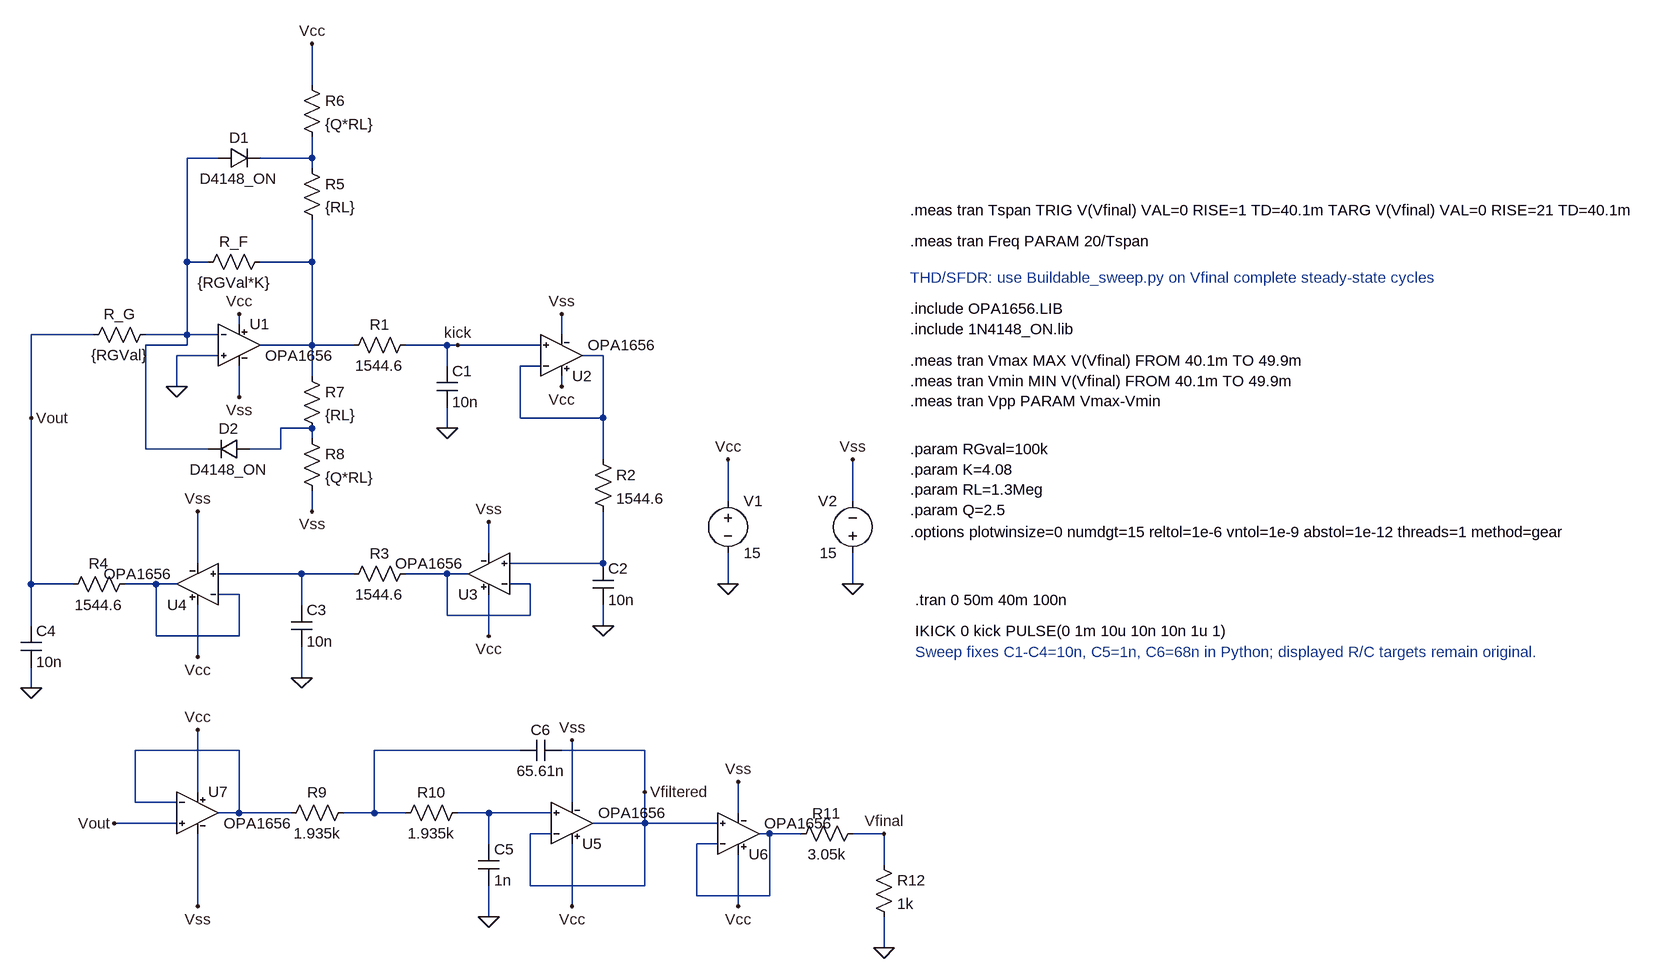
[diagram p0: schematic Oscillator.asc]
Oscillator.asc, the LTspice schematic file:
Version 4.1
SHEET 1 2392 1108
WIRE 272 -240 272 -304
WIRE 128 -128 80 -128
WIRE 272 -128 272 -160
WIRE 272 -128 192 -128
WIRE 272 -112 272 -128
WIRE 80 32 80 -128
WIRE 112 32 80 32
WIRE 272 32 272 -32
WIRE 272 32 192 32
WIRE 160 128 160 112
WIRE -64 144 -160 144
WIRE 80 144 80 32
WIRE 80 144 16 144
WIRE 128 144 80 144
WIRE 656 144 656 112
WIRE 80 160 80 144
WIRE 80 160 16 160
WIRE 272 160 272 32
WIRE 272 160 192 160
WIRE 336 160 272 160
WIRE 480 160 416 160
WIRE 496 160 480 160
WIRE 624 160 496 160
WIRE 128 176 64 176
WIRE 720 176 688 176
WIRE 480 192 480 160
WIRE 624 192 592 192
WIRE 272 208 272 160
WIRE 64 224 64 176
WIRE 656 224 656 208
WIRE 160 240 160 192
WIRE -160 272 -160 144
WIRE 592 272 592 192
WIRE 720 272 720 176
WIRE 720 272 592 272
WIRE 272 288 224 288
WIRE 480 288 480 256
WIRE 272 304 272 288
WIRE 16 320 16 160
WIRE 112 320 16 320
WIRE 224 320 224 288
WIRE 224 320 176 320
WIRE 720 336 720 272
WIRE 912 400 912 336
WIRE 1104 400 1104 336
WIRE 272 416 272 384
WIRE 544 480 544 432
WIRE 96 496 96 416
WIRE 720 496 720 416
WIRE 720 496 576 496
WIRE 256 512 128 512
WIRE 336 512 256 512
WIRE 480 512 416 512
WIRE 512 512 480 512
WIRE -160 528 -160 272
WIRE -96 528 -160 528
WIRE 32 528 -16 528
WIRE 64 528 32 528
WIRE 608 528 576 528
WIRE 912 528 912 480
WIRE 1104 528 1104 480
WIRE 160 544 128 544
WIRE 256 560 256 512
WIRE 480 576 480 512
WIRE 608 576 608 528
WIRE 608 576 480 576
WIRE -160 592 -160 528
WIRE 720 592 720 560
WIRE 32 608 32 528
WIRE 160 608 160 544
WIRE 160 608 32 608
WIRE 544 608 544 544
WIRE 96 640 96 560
WIRE 256 672 256 624
WIRE -160 688 -160 656
WIRE 160 784 0 784
WIRE 592 784 368 784
WIRE 784 784 656 784
WIRE 96 848 96 752
WIRE 784 848 784 784
WIRE 0 864 0 784
WIRE 64 864 0 864
WIRE 672 864 672 768
WIRE 160 880 160 784
WIRE 160 880 128 880
WIRE 240 880 160 880
WIRE 368 880 368 784
WIRE 368 880 320 880
WIRE 416 880 368 880
WIRE 544 880 496 880
WIRE 640 880 544 880
WIRE 928 880 928 832
WIRE 64 896 -32 896
WIRE 784 896 784 848
WIRE 784 896 704 896
WIRE 896 896 784 896
WIRE 640 912 608 912
WIRE 976 912 960 912
WIRE 1024 912 976 912
WIRE 1152 912 1104 912
WIRE 544 928 544 880
WIRE 896 928 864 928
WIRE 1152 960 1152 912
WIRE 608 992 608 912
WIRE 784 992 784 896
WIRE 784 992 608 992
WIRE 864 1008 864 928
WIRE 976 1008 976 912
WIRE 976 1008 864 1008
WIRE 96 1024 96 912
WIRE 672 1024 672 928
WIRE 928 1024 928 944
WIRE 544 1040 544 992
WIRE 1152 1088 1152 1040
FLAG 64 224 0
FLAG 480 288 0
FLAG 720 592 0
FLAG 256 672 0
FLAG -160 688 0
FLAG 912 528 0
FLAG 912 336 Vcc
FLAG 1104 528 0
FLAG 1104 336 Vss
FLAG 160 112 Vcc
FLAG 160 240 Vss
FLAG 656 224 Vcc
FLAG 656 112 Vss
FLAG 544 608 Vcc
FLAG 544 432 Vss
FLAG 96 640 Vcc
FLAG 96 416 Vss
FLAG 496 160 kick
FLAG 272 -304 Vcc
FLAG 272 416 Vss
FLAG -160 272 Vout
FLAG -32 896 Vout
FLAG 96 752 Vcc
FLAG 96 1024 Vss
FLAG 544 1040 0
FLAG 672 1024 Vcc
FLAG 672 768 Vss
FLAG 784 848 Vfiltered
FLAG 1152 1088 0
FLAG 1152 912 Vfinal
FLAG 928 1024 Vcc
FLAG 928 832 Vss
SYMBOL OPA1656_channel 160 160 R0
SYMATTR InstName U1
SYMBOL res -80 160 R270
WINDOW 0 32 56 VTop 2
WINDOW 3 0 56 VBottom 2
SYMATTR InstName R_G
SYMATTR Value {RGVal}
SYMBOL res 208 16 R90
WINDOW 0 0 56 VBottom 2
WINDOW 3 32 56 VTop 2
SYMATTR InstName R_F
SYMATTR Value {RGVal*K}
SYMBOL res 432 144 R90
WINDOW 0 0 56 VBottom 2
WINDOW 3 32 56 VTop 2
SYMATTR InstName R1
SYMATTR Value 1544.6
SYMBOL cap 464 192 R0
SYMATTR InstName C1
SYMATTR Value 10n
SYMBOL OPA1656_channel 656 176 M180
SYMATTR InstName U2
SYMBOL res 704 320 R0
SYMATTR InstName R2
SYMATTR Value 1544.6
SYMBOL cap 704 496 R0
SYMATTR InstName C2
SYMATTR Value 10n
SYMBOL OPA1656_channel 544 512 R180
SYMATTR InstName U3
SYMBOL res 320 528 R270
WINDOW 0 32 56 VTop 2
WINDOW 3 0 56 VBottom 2
SYMATTR InstName R3
SYMATTR Value 1544.6
SYMBOL cap 240 560 R0
SYMATTR InstName C3
SYMATTR Value 10n
SYMBOL OPA1656_channel 96 528 R180
SYMATTR InstName U4
SYMBOL res 0 512 R90
WINDOW 0 0 56 VBottom 2
WINDOW 3 32 56 VTop 2
SYMATTR InstName R4
SYMATTR Value 1544.6
SYMBOL cap -176 592 R0
SYMATTR InstName C4
SYMATTR Value 10n
SYMBOL voltage 912 384 R0
SYMATTR InstName V1
SYMATTR Value 15
SYMBOL voltage 1104 496 R180
WINDOW 0 24 96 Left 2
WINDOW 3 24 16 Left 2
SYMATTR InstName V2
SYMATTR Value 15
SYMBOL res 256 -128 R0
SYMATTR InstName R5
SYMATTR Value {RL}
SYMBOL res 256 -256 R0
SYMATTR InstName R6
SYMATTR Value {Q*RL}
SYMBOL diode 128 -112 R270
WINDOW 0 32 32 VTop 2
WINDOW 3 0 32 VBottom 2
SYMATTR InstName D1
SYMATTR Value D4148_ON
SYMBOL res 256 192 R0
SYMATTR InstName R7
SYMATTR Value {RL}
SYMBOL res 256 288 R0
SYMATTR InstName R8
SYMATTR Value {Q*RL}
SYMBOL diode 176 304 R90
WINDOW 0 0 32 VBottom 2
WINDOW 3 32 32 VTop 2
SYMATTR InstName D2
SYMATTR Value D4148_ON
SYMBOL res 224 896 R270
WINDOW 0 32 56 VTop 2
WINDOW 3 0 56 VBottom 2
SYMATTR InstName R9
SYMATTR Value 1.935k
SYMBOL res 512 864 R90
WINDOW 0 0 56 VBottom 2
WINDOW 3 32 56 VTop 2
SYMATTR InstName R10
SYMATTR Value 1.935k
SYMBOL cap 528 928 R0
SYMATTR InstName C5
SYMATTR Value 1n
SYMBOL cap 656 768 R90
WINDOW 0 0 32 VBottom 2
WINDOW 3 32 32 VTop 2
SYMATTR InstName C6
SYMATTR Value 65.61n
SYMBOL OPA1656_channel 96 880 R0
SYMATTR InstName U7
SYMBOL OPA1656_channel 672 896 M180
SYMATTR InstName U5
SYMBOL res 1120 896 R90
WINDOW 0 0 56 VBottom 2
WINDOW 3 32 56 VTop 2
SYMATTR InstName R11
SYMATTR Value 3.05k
SYMBOL res 1136 944 R0
SYMATTR InstName R12
SYMATTR Value 1k
SYMBOL OPA1656_channel 928 912 M180
SYMATTR InstName U6
TEXT 1200 552 Left 2 !.tran 0 50m 40m 100n
TEXT 1200 600 Left 2 !IKICK 0 kick PULSE(0 1m 10u 10n 10n 1u 1)
TEXT 1192 104 Left 2 !.include OPA1656.LIB\n.include 1N4148_ON.lib
TEXT 1192 0 Left 2 !.meas tran Freq PARAM 20/Tspan
TEXT 1192 56 Left 2 ;THD/SFDR: use Buildable_sweep.py on Vfinal complete steady-state cycles
TEXT 1192 184 Left 2 !.meas tran Vmax MAX V(Vfinal) FROM 40.1m TO 49.9m\n.meas tran Vmin MIN V(Vfinal) FROM 40.1m TO 49.9m\n.meas tran Vpp PARAM Vmax-Vmin
TEXT 1192 320 Left 2 !.param RGval=100k\n.param K=4.08\n.param RL=1.3Meg\n.param Q=2.5
TEXT 1192 448 Left 2 !.options plotwinsize=0 numdgt=15 reltol=1e-6 vntol=1e-9 abstol=1e-12 threads=1 method=gear
TEXT 1200 632 Left 2 ;Sweep fixes C1-C4=10n, C5=1n, C6=68n in Python; displayed R/C targets remain original.
TEXT 1192 -48 Left 2 !.meas tran Tspan TRIG V(Vfinal) VAL=0 RISE=1 TD=40.1m TARG V(Vfinal) VAL=0 RISE=21 TD=40.1m

The netlist it stands for:
* Oscillator.asc
X§U1 0 N001 Vcc Vss N003 OPA1656  ; pins In+ In- V+ V- OUT
R_G Vout N001 {RGVal}
R_F N003 N001 {RGVal*K}
R1 kick N003 1544.6
C1 kick 0 10n
X§U2 kick N004 Vcc Vss N004 OPA1656  ; pins In+ In- V+ V- OUT
R2 N004 N006 1544.6
C2 N006 0 10n
X§U3 N006 N008 Vcc Vss N008 OPA1656  ; pins In+ In- V+ V- OUT
R3 N007 N008 1544.6
C3 N007 0 10n
X§U4 N007 N009 Vcc Vss N009 OPA1656  ; pins In+ In- V+ V- OUT
R4 N009 Vout 1544.6
C4 Vout 0 10n
V1 Vcc 0 15
V2 0 Vss 15
R5 N002 N003 {RL}
R6 Vcc N002 {Q*RL}
D1 N001 N002 D4148_ON
R7 N003 N005 {RL}
R8 N005 Vss {Q*RL}
D2 N005 N001 D4148_ON
R9 N010 N011 1.935k
R10 N012 N011 1.935k
C5 N012 0 1n
C6 Vfiltered N011 65.61n
X§U7 Vout N010 Vcc Vss N010 OPA1656  ; pins In+ In- V+ V- OUT
X§U5 N012 Vfiltered Vcc Vss Vfiltered OPA1656  ; pins In+ In- V+ V- OUT
R11 Vfinal N013 3.05k
R12 Vfinal 0 1k
X§U6 Vfiltered N013 Vcc Vss N013 OPA1656  ; pins In+ In- V+ V- OUT
.model D D
.lib standard.dio
.tran 0 50m 40m 100n
IKICK 0 kick PULSE(0 1m 10u 10n 10n 1u 1)
.include OPA1656.LIB
.include 1N4148_ON.lib
.meas tran Freq PARAM 20/Tspan
* THD/SFDR: use Buildable_sweep.py on Vfinal complete steady-state cycles
.meas tran Vmax MAX V(Vfinal) FROM 40.1m TO 49.9m
.meas tran Vmin MIN V(Vfinal) FROM 40.1m TO 49.9m
.meas tran Vpp PARAM Vmax-Vmin
.param RGval=100k
.param K=4.08
.param RL=1.3Meg
.param Q=2.5
.options plotwinsize=0 numdgt=15 reltol=1e-6 vntol=1e-9 abstol=1e-12 threads=1 method=gear
* Sweep fixes C1-C4=10n, C5=1n, C6=68n in Python; displayed R/C targets remain original.
.meas tran Tspan TRIG V(Vfinal) VAL=0 RISE=1 TD=40.1m TARG V(Vfinal) VAL=0 RISE=21 TD=40.1m
.backanno
.end